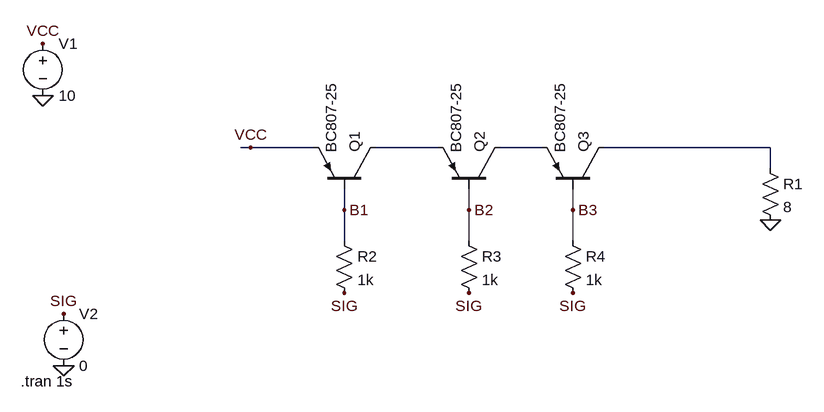
[diagram p0: schematic 3x_pnp.asc]
3x_pnp.asc, the LTspice schematic file:
Version 4
SHEET 1 880 680
WIRE -16 0 -32 0
WIRE 80 0 -16 0
WIRE 272 0 176 0
WIRE 432 0 368 0
WIRE 784 0 528 0
WIRE 784 32 784 0
WIRE 128 96 128 64
WIRE 320 96 320 64
WIRE 480 96 480 64
WIRE 128 144 128 96
WIRE 320 144 320 96
WIRE 480 144 480 96
FLAG 784 112 0
FLAG -16 0 VCC
FLAG -336 -160 VCC
FLAG -336 -80 0
FLAG -304 256 SIG
FLAG 128 224 SIG
FLAG 320 224 SIG
FLAG 480 224 SIG
FLAG -304 336 0
FLAG 128 96 B1
FLAG 320 96 B2
FLAG 480 96 B3
SYMBOL pnp 176 64 M270
SYMATTR InstName Q1
SYMATTR Value BC807-25
SYMBOL pnp 368 64 M270
SYMATTR InstName Q2
SYMATTR Value BC807-25
SYMBOL pnp 528 64 M270
SYMATTR InstName Q3
SYMATTR Value BC807-25
SYMBOL voltage -336 -176 R0
WINDOW 123 0 0 Left 2
WINDOW 39 0 0 Left 2
SYMATTR InstName V1
SYMATTR Value 10
SYMBOL res 768 16 R0
SYMATTR InstName R1
SYMATTR Value 8
SYMBOL res 112 128 R0
SYMATTR InstName R2
SYMATTR Value 1k
SYMBOL res 304 128 R0
SYMATTR InstName R3
SYMATTR Value 1k
SYMBOL res 464 128 R0
SYMATTR InstName R4
SYMATTR Value 1k
SYMBOL voltage -304 240 R0
WINDOW 123 0 0 Left 2
WINDOW 39 0 0 Left 2
SYMATTR InstName V2
SYMATTR Value 0
TEXT -370 360 Left 2 !.tran 1s

The netlist it stands for:
* 3x_pnp.asc
Q1 N001 B1 VCC 0 BC807-25
Q2 N002 B2 N001 0 BC807-25
Q3 N003 B3 N002 0 BC807-25
V1 VCC 0 10
R1 N003 0 8
R2 B1 SIG 1k
R3 B2 SIG 1k
R4 B3 SIG 1k
V2 SIG 0 0
.model NPN NPN
.model PNP PNP
.lib standard.bjt
.tran 1s
.backanno
.end